# Altium schematic sheet NE006NG.schdoc
size 127 x 101 mm
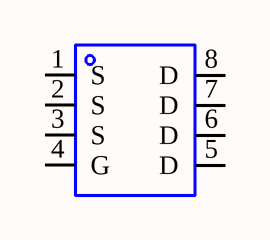
[diagram p0: NE006NG.schdoc]

## Parts
Q?  ne006ng  [DFN5X6-8_L5.8-W5.0-P1.27-LS6.2-BL-EP]  (value not drawn)

## Nets

Not connected (* = marked no-connect by the designer): Q? 1(S) 2(S) 3(S) 4(G) 5(D) 6(D) 7(D) 8(D)

## Library data of the parts
Q? = ne006ng: 数量:1个N沟道;漏源电压(Vdss):60V;连续漏极电流(Id):70A;导通电阻(RDS(on)):4.6mΩ@10V;耗散功率(Pd):84W;阈值电压(Vgs(th)):2.7V;; Manufacturer: DOINGTER(杜因特); AddInBom: yes; ModelId: 82d86f10988147ef9b82700d9bd42f65; ModelTransform: 200.787,239.17275,0,0,0,0,0.002,-0.004,0; Number: 1个N沟道; Drain to Source Voltage: 60V; Current - Continuous Drain(Id): 70A; Pd - Power Dissipation: 84W; Gate Threshold Voltage (Vgs(th)): 2.7V; Gate Charge(Qg): 90nC@10V; Input Capacitance(Ciss): 4nF; Reverse Transfer Capacitance (Crss@Vds): 252pF; Type: N沟道; Output Capacitance(Coss): 309pF; LCSC Part Name: N沟道MOSFET采用先进沟槽技术，具备低栅极电荷和出色散热性能; SupplierPart: C54157801; ManufacturerPart: NE006NG; Supplier Footprint: DFN-8(5x6); JLCPCB Part Class: Extended Part; Datasheet: https://item.szlcsc.com/datasheet/NE006NG/57396370.html; Supplier: LCSC; ConvertToPcb: yes; SymbolName: NE006NG; FootprintName: DFN5X6-8_L5.8-W5.0-P1.27-LS6.2-BL-EP; ModelName: DFN5X6-8_L5.8-W5.0-P1.27-LS6.2-BL-EP; RDS(on): 4.6mΩ@10V; Operating Temperature: -50℃~+150℃